# Altium schematic sheet GR_carte_PiHat27.SchDoc
size A4; SheetNumber: 1; SheetTotal: 1
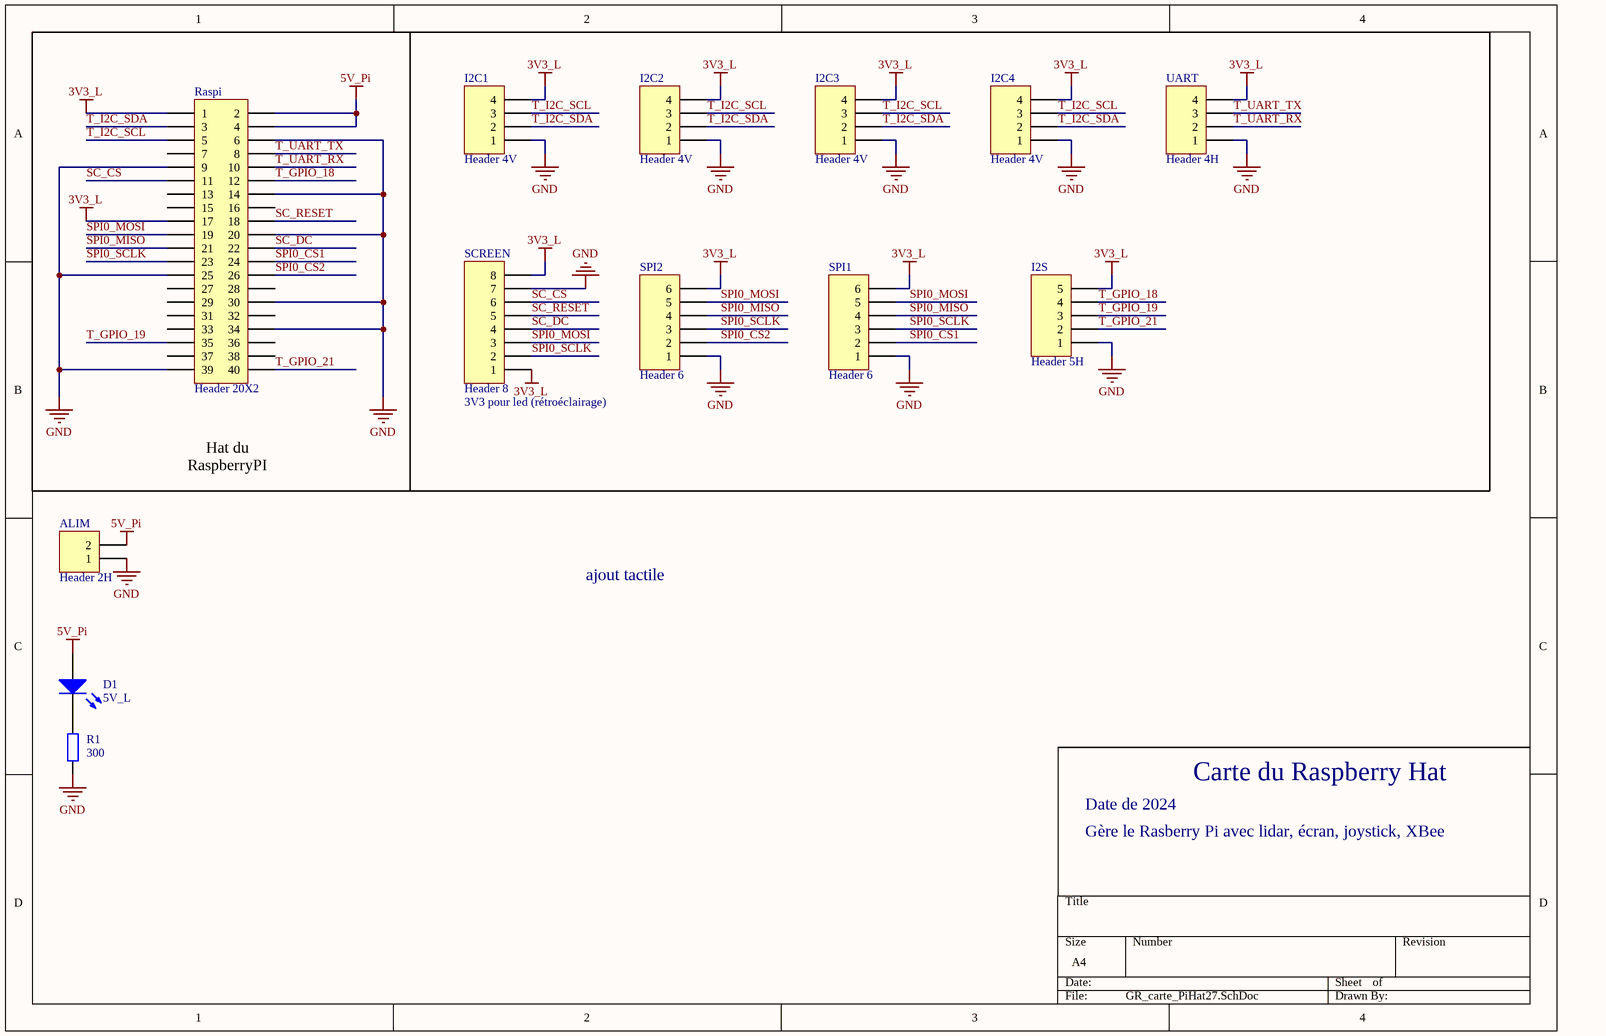
[diagram p0: GR_carte_PiHat27.SchDoc]

## Parts
ALIM  Header 2H  [Molex_MiniFitJr_2x1H]
D1  5V_L  [KP-3216SEC]
I2C1  Header 4V  [B4BXHALFSN]
I2C2  Header 4V  [B4BXHALFSN]
I2C3  Header 4V  [B4BXHALFSN]
I2C4  Header 4V  [B4BXHALFSN]
I2S  Header 5H  [S5B-XH-A]
R1  value 300  [Resistor 1206]  (hidden comment: Res2)
Raspi  Header 20X2  [HDR2X20]
SCREEN  Header 8  [JST XH B8B-XH-A]
SPI1  Header 6  [JST XH B6B-XH-A]
SPI2  Header 6  [JST XH B6B-XH-A]
UART  Header 4H  [S4B-XH-A]

## Blocks framed on the sheet
3V3 pour led (rétroéclairage): I2C1-I2C4 I2S SCREEN SPI1 SPI2 UART

## Nets
3V3_L: I2C1.4 I2C2.4 I2C3.4 I2C4.4 I2S.5 Raspi.1 Raspi.17 SCREEN.1 SCREEN.8 SPI1.6 SPI2.6 UART.4
5V_Pi: ALIM.2 D1.1(A) Raspi.2 Raspi.4
GND: ALIM.1 I2C1.1 I2C2.1 I2C3.1 I2C4.1 I2S.1 R1.1 Raspi.6 Raspi.9 Raspi.14 Raspi.20 Raspi.25 Raspi.30 Raspi.34 Raspi.39 SCREEN.7 SPI1.1 SPI2.1 UART.1
SC_CS: Raspi.11 SCREEN.6
SC_DC: Raspi.22 SCREEN.4
SC_RESET: Raspi.18 SCREEN.5
SPI0_CS1: Raspi.24 SPI1.2
SPI0_CS2: Raspi.26 SPI2.2
SPI0_MISO: Raspi.21 SPI1.4 SPI2.4
SPI0_MOSI: Raspi.19 SCREEN.3 SPI1.5 SPI2.5
SPI0_SCLK: Raspi.23 SCREEN.2 SPI1.3 SPI2.3
T_GPIO_18: I2S.4 Raspi.12
T_GPIO_19: I2S.3 Raspi.35
T_GPIO_21: I2S.2 Raspi.40
T_I2C_SCL: I2C1.3 I2C2.3 I2C3.3 I2C4.3 Raspi.5
T_I2C_SDA: I2C1.2 I2C2.2 I2C3.2 I2C4.2 Raspi.3
T_UART_RX: Raspi.10 UART.2
T_UART_TX: Raspi.8 UART.3
NetD1_2: D1.2(K) R1.2

Not connected (* = marked no-connect by the designer): Raspi 7 13 15 16 27 28 29 31 32 33 36 37 38

## Notes on the sheet
- Hat du RaspberryPI
- ajout tactile
- Carte du Raspberry Hat
- Date de 2024
- Gère le Rasberry Pi avec lidar, écran, joystick, XBee

## Library data of the parts
ALIM = Header 2H: Header, 2-Pin, Right Angle; LatestRevisionDate: 17-Jul-2002; LatestRevisionNote: Re-released for DXP Platform.; Publisher: Altium Limited
D1 = LED2: Typical RED, GREEN, YELLOW, AMBER GaAs LED; Published: 8-Jun-2000; LatestRevisionDate: 17-Jul-2002; LatestRevisionNote: Re-released for DXP Platform.; PackageVersion: Feb-2002; PackageReference: 3.2X1.6X1.1; Publisher: Altium Limited; PackageDescription: SM LED; 2 Flat Leads
I2C1-I2C4 UART = Header 4H: Header, 4-Pin, Right Angle; LatestRevisionDate: 17-Jul-2002; LatestRevisionNote: Re-released for DXP Platform.; Publisher: Altium Limited
I2S = Header 5H: Header, 5-Pin, Right Angle; LatestRevisionDate: 17-Jul-2002; LatestRevisionNote: Re-released for DXP Platform.; Publisher: Altium Limited
R1 = Res2: Resistor; Published: 8-Jun-2000; LatestRevisionDate: 17-Jul-2002; LatestRevisionNote: Re-released for DXP Platform.; PackageReference: AXIAL-0.4; Publisher: Altium Limited; PackageDescription: Axial Device, Thru-Hole; 2 Leads; 0.4 in Pin Spacing
Raspi = Header 20X2: Header, 20-Pin, Dual row; LatestRevisionDate: 17-Jul-2002; LatestRevisionNote: Re-released for DXP Platform.; Publisher: Altium Limited
SCREEN = Header 8: Header, 8-Pin; LatestRevisionDate: 17-Jul-2002; LatestRevisionNote: Re-released for DXP Platform.; Publisher: Altium Limited
SPI1 SPI2 = Header 6: Header, 6-Pin; LatestRevisionDate: 17-Jul-2002; LatestRevisionNote: Re-released for DXP Platform.; Publisher: Altium Limited